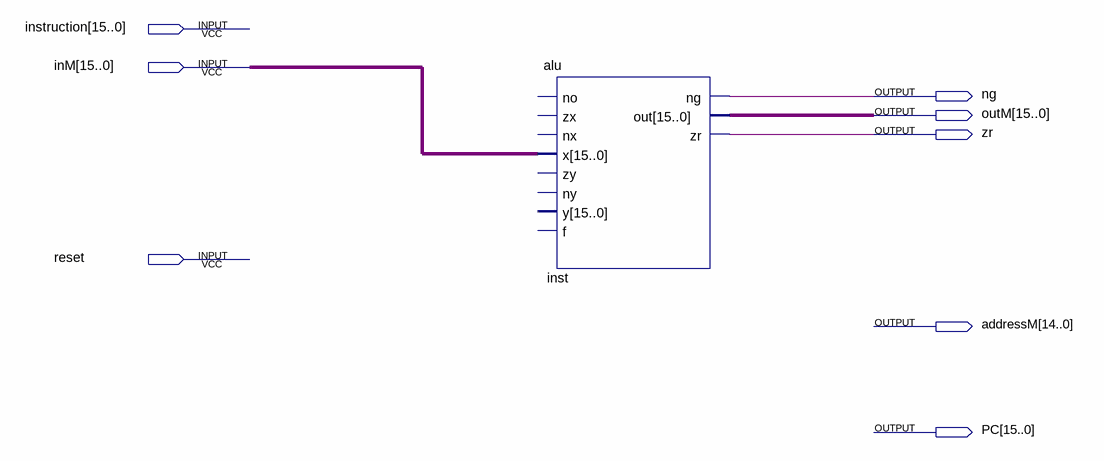
[diagram p0: schematic sheet]
// Quartus schematic cpu.bdf as structural Verilog: 1 symbols, 8 pins
module cpu (
  input  [15:0] instruction,
  input  [15:0] inM,
  input  reset,
  output ng,
  output [15:0] outM,
  output zr,
  output [14:0] addressM,
  output [15:0] PC
);

  alu inst (.x(inM), .ng(ng), .out(outM), .zr(zr));  // open: no, zx, nx, zy, ny, y, f
endmodule
